# Altium schematic sheet Light_Detection.SchDoc
size A4; Date: *******; ApprovedBy: *******; CheckedBy: None; Author: *******; CompanyName: *******; DrawnBy: Name; Engineer: *******; Organization: *******; Address1: *******; Address2: *******; Address3: *******; Address4: *******; DocumentNumber: Doc Num; Revision: *******; SheetNumber: 7; SheetTotal: 8; CurrentTime: *******; CurrentDate: *******; Time: *******; DocumentFullPathAndName: *******; DocumentName: *******; ModifiedDate: *******; ImagePath: *******; ProjectName: *******; Application_BuildNumber: *******
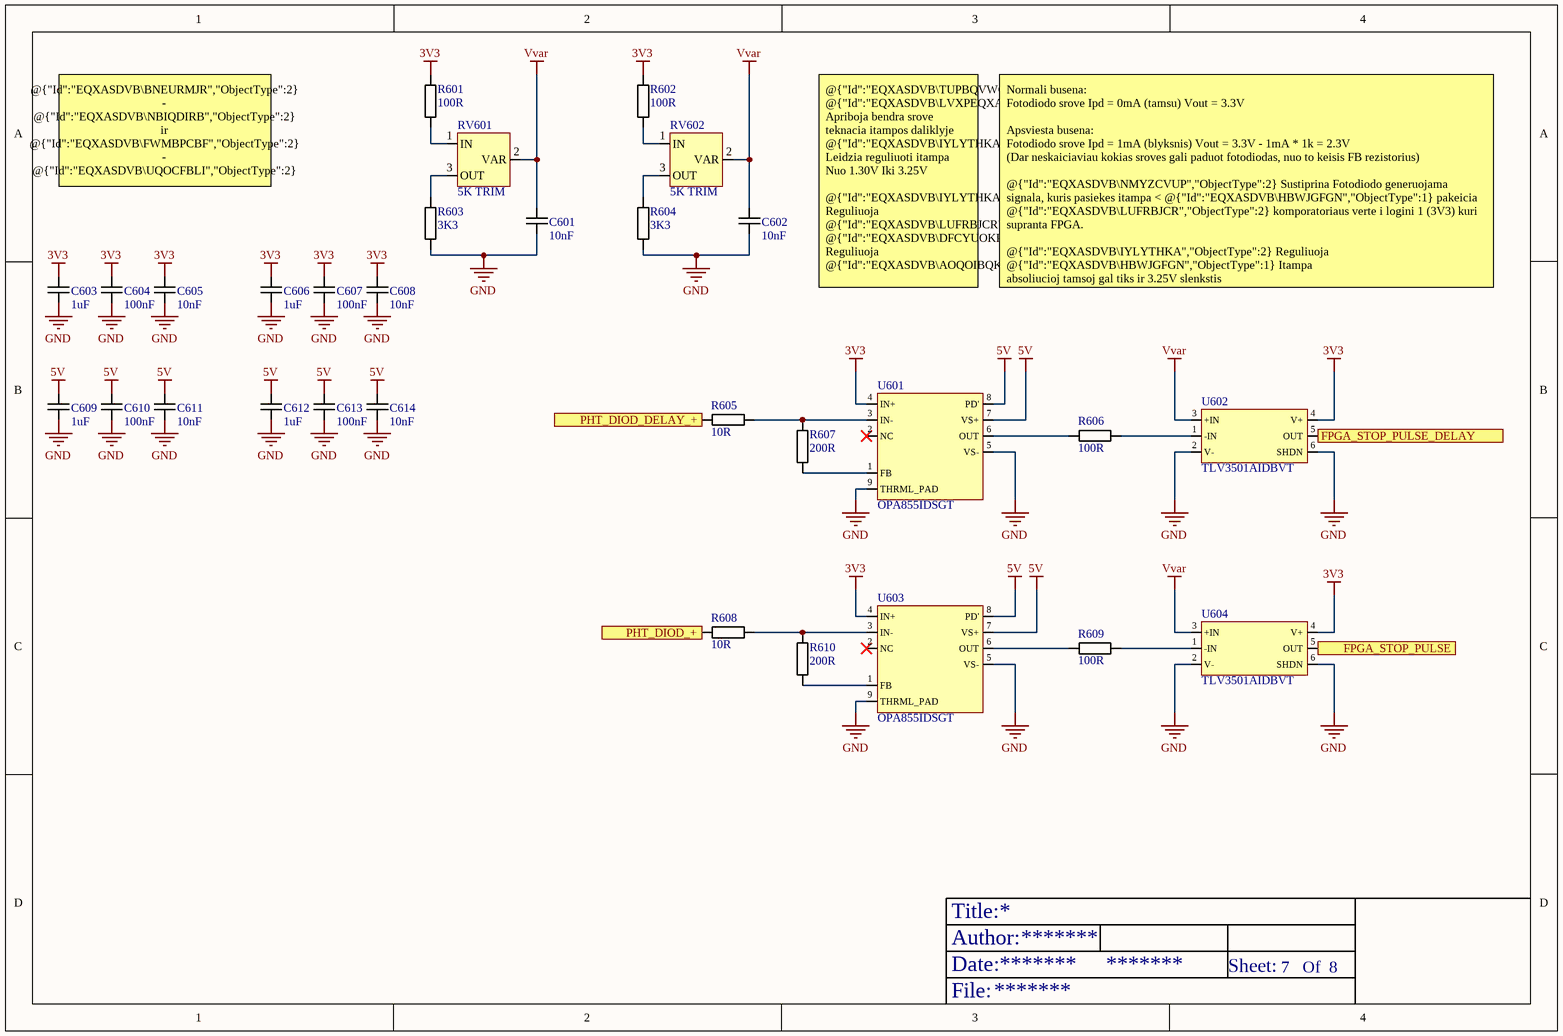
[diagram p0: Light_Detection.SchDoc]

## Parts
C601  10nF  [10nF 0402]
C602  10nF  [10nF 0402]
C603  1uF  [1uF 0603]
C604  100nF  [100nF 0402]
C605  10nF  [10nF 0402]
C606  1uF  [1uF 0603]
C607  100nF  [100nF 0402]
C608  10nF  [10nF 0402]
C609  1uF  [1uF 0603]
C610  100nF  [100nF 0402]
C611  10nF  [10nF 0402]
C612  1uF  [1uF 0603]
C613  100nF  [100nF 0402]
C614  10nF  [10nF 0402]
R601  100R  [100R 0402]
R602  100R  [100R 0402]
R603  3K3  [3k3 0402]
R604  3K3  [3k3 0402]
R605  10R  [10R 0402]
R606  100R  [100R 0402]
R607  200R  [200R 0402]
R608  10R  [10R 0402]
R609  100R  [100R 0402]
R610  200R  [200R 0402]
RV601  5K TRIM  [5K TRIM]
RV602  5K TRIM  [5K TRIM]
U601  OPA855IDSGT  [OPA855IDSGT]
U602  TLV3501AIDBVT  [TLV3501AIDBVT]
U603  OPA855IDSGT  [OPA855IDSGT]
U604  TLV3501AIDBVT  [TLV3501AIDBVT]

## Ports
FPGA_STOP_PULSE (see Inputs_Outputs[4C]), FPGA_STOP_PULSE_DELAY (see Inputs_Outputs[4B]), PHT_DIOD_+ (see Laser_System[3C]), PHT_DIOD_DELAY_+ (see Laser_System[3B])

## Nets
3V3: C603.2 C604.2 C605.2 C606.2 C607.2 C608.2 R601.1 R602.1 U601.4(IN+) U602.4(V+) U603.4(IN+) U604.4(V+)
5V: C609.2 C610.2 C611.2 C612.2 C613.2 C614.2 U601.7(VS+) U601.8(PD') U603.7(VS+) U603.8(PD')
GND: C601.1 C602.1 C603.1 C604.1 C605.1 C606.1 C607.1 C608.1 C609.1 C610.1 C611.1 C612.1 C613.1 C614.1 R603.2 R604.2 U601.5(VS-) U601.9(THRML_PAD) U602.2(V-) U602.6(SHDN) U603.5(VS-) U603.9(THRML_PAD) U604.2(V-) U604.6(SHDN)
Vvar: C601.2 C602.2 RV601.2(VAR) RV602.2(VAR) U602.3(+IN) U604.3(+IN)
FPGA_STOP_PULSE: U604.5(OUT) ; port FPGA_STOP_PULSE
FPGA_STOP_PULSE_DELAY: U602.5(OUT) ; port FPGA_STOP_PULSE_DELAY
PHT_DIOD_+: R608.1 ; port PHT_DIOD_+
PHT_DIOD_DELAY_+: R605.1 ; port PHT_DIOD_DELAY_+
NetR601_2: R601.2 RV601.1(IN)
NetR602_2: R602.2 RV602.1(IN)
NetR603_1: R603.1 RV601.3(OUT)
NetR604_1: R604.1 RV602.3(OUT)
NetR605_2: R605.2 R607.2 U601.3(IN-)
NetR606_1: R606.1 U601.6(OUT)
NetR606_2: R606.2 U602.1(-IN)
NetR607_1: R607.1 U601.1(FB)
NetR608_2: R608.2 R610.2 U603.3(IN-)
NetR609_1: R609.1 U603.6(OUT)
NetR609_2: R609.2 U604.1(-IN)
NetR610_1: R610.1 U603.1(FB)

Not connected (* = marked no-connect by the designer): U601 2(NC)*; U603 2(NC)*

## Notes on the sheet
- @{"Id":"EQXASDVB\BNEURMJR","ObjectType":2} - @{"Id":"EQXASDVB\NBIQDIRB","ObjectType":2} ir @{"Id":"EQXASDVB\FWMBPCBF","ObjectType":2} - @{"Id":"EQXASDVB\UQOCFBLI","ObjectType":2}
  Reikalingi filtravimui, bei stabilios itampos islaikymui.
  Kiekviena eile kondensatoriu lituojasi kuo arciau mikruskes
  @{"Id":"EQXASDVB\NMYZCVUP","ObjectType":2} - @{"Id":"EQXASDVB\AOQOIBQK","ObjectType":2}
- @{"Id":"EQXASDVB\TUPBQVWC","ObjectType":2} @{"Id":"EQXASDVB\LVXPEQXA","ObjectType":2} Apriboja bendra srove teknacia itampos daliklyje
  @{"Id":"EQXASDVB\IYLYTHKA","ObjectType":2} Leidzia reguliuoti itampa
  Nuo 1.30V Iki 3.25V
  @{"Id":"EQXASDVB\IYLYTHKA","ObjectType":2} Reguliuoja @{"Id":"EQXASDVB\LUFRBJCR","ObjectType":2}
  @{"Id":"EQXASDVB\DFCYUOKP","ObjectType":2} Reguliuoja @{"Id":"EQXASDVB\AOQOIBQK","ObjectType":2}
- Normali busena:
  Fotodiodo srove Ipd = 0mA (tamsu) Vout = 3.3V
  Apsviesta busena:
  Fotodiodo srove Ipd = 1mA (blyksnis) Vout = 3.3V - 1mA * 1k = 2.3V
  (Dar neskaiciaviau kokias sroves gali paduot fotodiodas, nuo to keisis FB rezistorius)
  @{"Id":"EQXASDVB\NMYZCVUP","ObjectType":2} Sustiprina Fotodiodo generuojama signala, kuris pasiekes itampa < @{"Id":"EQXASDVB\HBWJGFGN","ObjectType":1} pakeicia @{"Id":"EQXASDVB\LUFRBJCR","ObjectType":2} komporatoriaus verte i logini 1 (3V3) kuri supranta FPGA.
  @{"Id":"EQXASDVB\IYLYTHKA","ObjectType":2} Reguliuoja @{"Id":"EQXASDVB\HBWJGFGN","ObjectType":1} Itampa
  absoliucioj tamsoj gal tiks ir 3.25V slenkstis
  Apsviestam kambari gali but reikes ir 1.30V slenkscio
- Title:
- Date:
- Author:
- Sheet:
- Of
- File:

## Library data of the parts
C601 C602 C605 C608 C611 C614 = 10nF 0402: C0402C103J5RACTU
C603 C606 C609 C612 = 1uF 0603: CGA3E1X7R1E105K080AC
C604 C607 C610 C613 = 100n 0402: C1005X7R1E104K050BB
R601 R602 R606 R609 = 100R 0402: ERA-2VEB1000X
R603 R604 = 3K3 0402: ERJ-U02F3301X
R605 R608 = 10R 0402: CRT0402-DZ-10R0GLF
R607 R610 = 200R 0402: ERA-2AED201X
RV601 RV602 = 5K TRIM: 3314G-1-502E
U601 U603 = OPA855IDSGT: OP ampas
U602 U604 = TLV3501AIDBVT: Comparatorius